# Altium schematic sheet Top-Sheet.SchDoc
size A4; DocumentNumber: 1; SheetNumber: 1; SheetTotal: 4
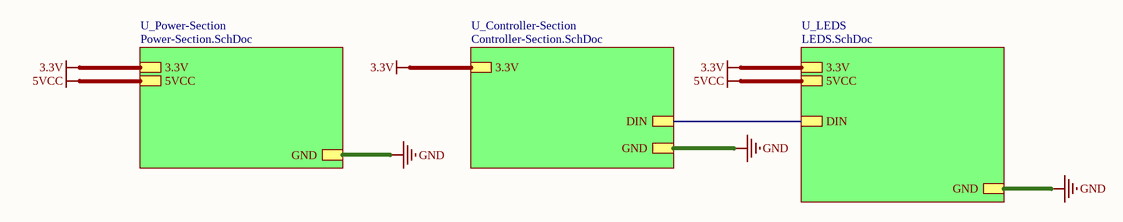
[diagram p0: Top-Sheet.SchDoc]

## Sub-sheets
U_Controller-Section = Controller-Section.SchDoc: 3.3V, GND, DIN
U_LEDS = LEDS.SchDoc: GND, 5VCC, DIN, 3.3V
U_Power-Section = Power-Section.SchDoc: GND, 5VCC, 3.3V

## Nets
3.3V: sheet U_LEDS/3.3V, sheet U_Power-Section/3.3V, sheet U_Controller-Section/3.3V
5VCC: sheet U_LEDS/5VCC, sheet U_Power-Section/5VCC
GND: sheet U_LEDS/GND, sheet U_Power-Section/GND, sheet U_Controller-Section/GND
(unnamed): sheet U_LEDS/DIN, sheet U_Controller-Section/DIN

## Notes on the sheet
- File:
- Title:
- Date:
- Page
- Num:
- Total:
- Drawn By: Huzaifa Ali